# Altium schematic sheet PFC-Sheet-ch4.SchDoc (part 1 of 3)
size 420 x 297 mm; SheetNumber: 5; SheetTotal: 10
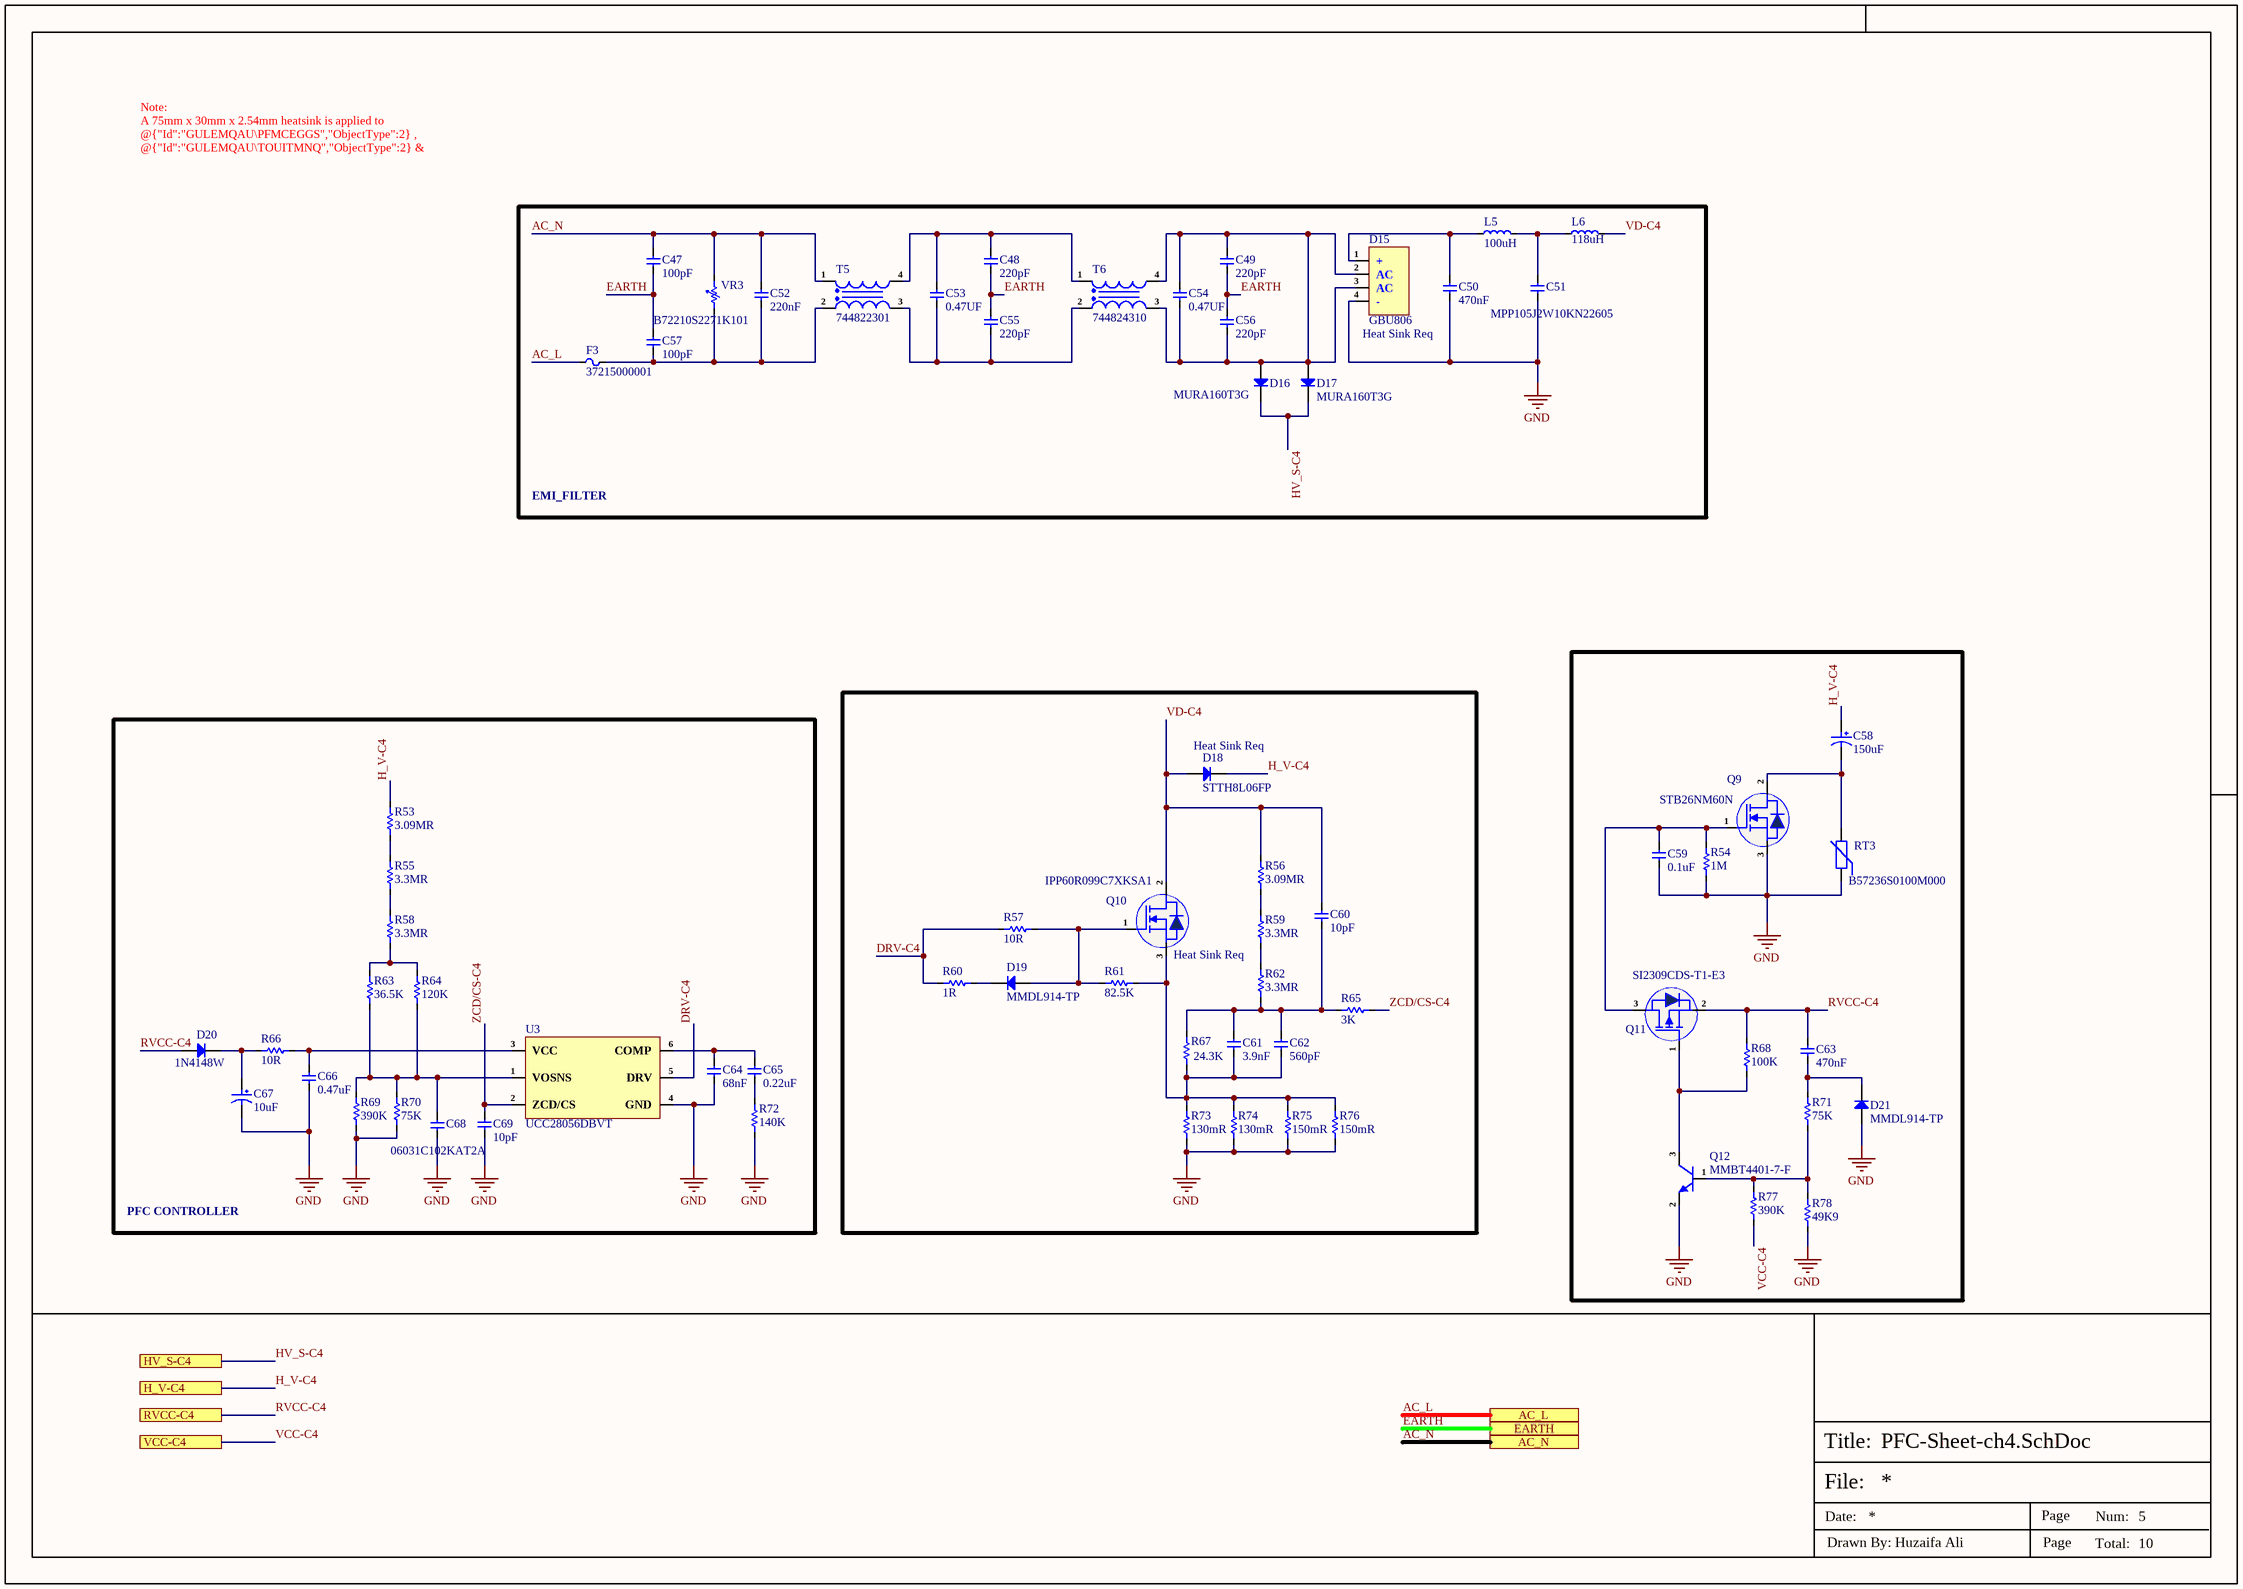
[diagram p0: PFC-Sheet-ch4.SchDoc]

## Parts
C47  100pF  [DE1B3RA101KN4AN01F]
C48  220pF  [DE1B3RA221KN4AN01F]
C49  220pF  [DE1B3RA221KN4AN01F]
C50  470nF  [450MPK474J]
C51  MPP105J2W10KN22605  [MPP105J2W10KN22605]
C52  220nF  [X2P2224KN1B0130150080ES0]
C53  0.47UF  [890324024005]
C54  0.47UF  [890324024005]
C55  220pF  [DE1B3RA221KN4AN01F]
C56  220pF  [DE1B3RA221KN4AN01F]
C57  100pF  [DE1B3RA101KN4AN01F]
C58  150uF  [KN151M45025*30A]
C59  0.1uF  [Cap-0603]
C60  10pF  [Cap-1206]
C61  3.9nF  [Cap-0603]
C62  560pF  [Cap-0603]
C63  470nF  [Cap-1206]
C64  68nF  [Cap-0603]
C65  0.22uF  [Cap-0603]
C66  0.47uF  [Cap-1206]
C67  10uF  [50SVPF10M]
C68  06031C102KAT2A  [Cap-0603]
C69  10pF  [Cap-0603]
D15  GBU806  [GBU]
D16  MURA160T3G  [SMA]
D17  MURA160T3G  [SMA]
D18  STTH8L06FP  [TO-220-2]
D19  MMDL914-TP  [SOD-323]
D20  1N4148W  [SOD-123]
D21  MMDL914-TP  [SOD-323]
F3  37215000001  [37215000001]
L5  100uH  [7447021]
L6  118uH  [760801401]
Q9  STB26NM60N  [TO-263]
Q10  IPP60R099C7XKSA1  [TO-220-3]
Q11  SI2309CDS-T1-E3  [SOT-23]
Q12  MMBT4401-7-F  [SOT-23]
R53  3.09MR  [Res-1206]
R54  1M  [RES-0805]
R55  3.3MR  [Res-1206]
R56  3.09MR  [Res-1206]
R57  10R  [Res-0603]
R58  3.3MR  [Res-1206]
R59  3.3MR  [Res-1206]
R60  1R  [Res-0603]
R61  82.5K  [Res-0603]
R62  3.3MR  [Res-1206]
R63  36.5K  [Res-0603]
R64  120K  [Res-0603]
R65  3K  [Res-0603]
R66  10R  [RES-0805]
R67  24.3K  [Res-0603]
R68  100K  [Res-0603]
R69  390K  [Res-0603]
R70  75K  [Res-0603]
R71  75K  [Res-0603]
R72  140K  [Res-0603]
R73  130mR  [Res-1206]
R74  130mR  [Res-1206]
R75  150mR  [Res-1206]
R76  150mR  [Res-1206]
R77  390K  [Res-0603]
R78  49K9  [Res-0603]
RT3  B57236S0100M000  [B57236S0100M000]
T5  744822301  [744822301]
T6  744824310  [744824310]
U3  UCC28056DBVT  [SOT-23-6]
VR3  B72210S2271K101  [B72210S2271K101]

## Blocks framed on the sheet
PFC CONTROLLER: C64-C69 D20 R53 R55 R58 R63 R64 R66 R69 R70 R72 U3

## Ports
AC_L (see Top-Sheet[4B], Connector-Sheet[5D], PFC-Sheet-ch2[4D], PFC-Sheet-ch3[4D], PFC-Sheet[4D]), AC_N (see Top-Sheet[4B], Connector-Sheet[5D], PFC-Sheet-ch2[4D], PFC-Sheet-ch3[4D], PFC-Sheet[4D]), EARTH (see Top-Sheet[4B], Connector-Sheet[5D], PFC-Sheet-ch2[4D], PFC-Sheet-ch3[4D], PFC-Sheet[4D]), H_V-C4 (see Top-Sheet[5B], Power_Controller-Sheet-ch4[4D]), HV_S-C4 (see Top-Sheet[5B], Power_Controller-Sheet-ch4[4D]), RVCC-C4 (see Top-Sheet[5B], Power_Controller-Sheet-ch4[4D]), VCC-C4 (see Top-Sheet[5C], Power_Controller-Sheet-ch4[4D])

## Nets
GND: C50.1 C51.1 C59.1 C64.1 C66.1 C67.2 C68.1 C69.2 D15.4(-) D21.2(A) Q9.3(S) Q12.2(E) R54.1 R69.1 R70.1 R72.1 R73.2 R74.2 R75.1 R76.1 R78.1 RT3.1 U3.4(GND)
AC_L: F3.1 ; port AC_L
AC_N: C47.2 C52.2 T5.1 VR3.2 ; port AC_N
DRV-C4: R57.1 R60.1 U3.5(DRV)
EARTH: C47.1 C48.1 C49.1 C55.2 C56.2 C57.2 ; port EARTH
H_V-C4: C58.1 D18.1(K) R53.2 ; port H_V-C4
HV_S-C4: D16.1(K) D17.1(K) ; port HV_S-C4
RVCC-C4: C63.2 D20.1(A) Q11.2(S) R68.2 ; port RVCC-C4
VCC-C4: R77.1 ; port VCC-C4
VD-C4: C60.2 D18.2(A) L6.2 Q10.2(D) R56.2
ZCD/CS-C4: C69.1 R65.2 U3.2(ZCD/CS)
NetC48_2: C48.2 C53.2 T5.4 T6.1
NetC49_2: C49.2 C54.1 C54.2 C56.1 D15.2(AC) D15.3(AC) D16.2(A) D17.2(A) T6.3 T6.4
NetC50_2: C50.2 D15.1(+) L5.1
NetC51_2: C51.2 L5.2 L6.1
NetC52_1: C52.1 C57.1 F3.2 T5.2 VR3.1
NetC53_1: C53.1 C55.1 T5.3 T6.2
NetC58_2: C58.2 Q9.2(D) RT3.2
NetC59_2: C59.2 Q9.1(G) Q11.3(D) R54.2
NetC60_1: C60.1 C61.2 C62.2 R62.1 R65.1 R67.2
NetC61_1: C61.1 C62.1 Q10.3(S) R61.2 R67.1 R73.1 R74.1 R75.2 R76.2
NetC63_1: C63.1 D21.1(K) R71.2
NetC64_2: C64.2 C65.2 U3.6(COMP)
NetC65_1: C65.1 R72.2
NetC66_2: C66.2 R66.2 U3.3(VCC)
NetC67_1: C67.1 D20.2(K) R66.1
NetC68_2: C68.2 R63.1 R64.1 R69.2 R70.2 U3.1(VOSNS)
NetD19_1: D19.1(K) R60.2
NetD19_2: D19.2(A) Q10.1(G) R57.2 R61.1
NetQ11_1: Q11.1(G) Q12.3(C) R68.1
NetQ12_1: Q12.1(B) R71.1 R77.2 R78.2
NetR53_1: R53.1 R55.2
NetR55_1: R55.1 R58.2
NetR56_1: R56.1 R59.2
NetR58_1: R58.1 R63.2 R64.2
NetR59_1: R59.1 R62.2

## Notes on the sheet
- Note:
  A 75mm x 30mm x 2.54mm heatsink is applied to @{"Id":"GULEMQAU\PFMCEGGS","ObjectType":2} , @{"Id":"GULEMQAU\TOUITMNQ","ObjectType":2} & @{"Id":"GULEMQAU\GBZFHGUF","ObjectType":2}
- Heat Sink Req
- EMI_FILTER
- (near D18) Heat Sink Req
- File:
- Title:
- Date:
- Page
- Num:
- Total:
- Drawn By: Huzaifa Ali